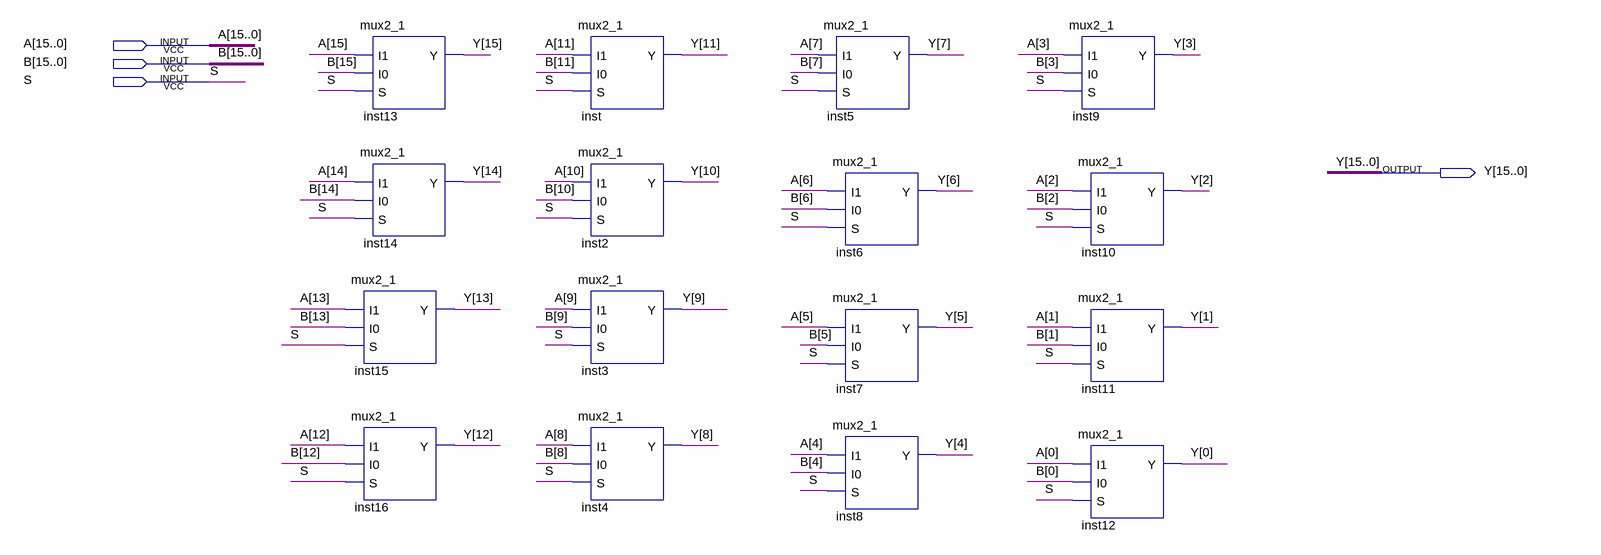
[diagram p0: schematic sheet]
// Quartus schematic mux2_1_16bit.bdf as structural Verilog: 16 symbols, 4 pins
module mux2_1_16bit (
  input  [15:0] A,
  input  [15:0] B,
  input  S,
  output [15:0] Y
);

  mux2_1 inst13 (.I1(A[15]), .I0(B[15]), .S(S), .Y(Y[15]));
  mux2_1 inst14 (.I1(A[14]), .I0(B[14]), .S(S), .Y(Y[14]));
  mux2_1 inst15 (.I1(A[13]), .I0(B[13]), .S(S), .Y(Y[13]));
  mux2_1 inst16 (.I1(A[12]), .I0(B[12]), .S(S), .Y(Y[12]));
  mux2_1 inst (.I1(A[11]), .I0(B[11]), .S(S), .Y(Y[11]));
  mux2_1 inst2 (.I1(A[10]), .I0(B[10]), .S(S), .Y(Y[10]));
  mux2_1 inst3 (.I1(A[9]), .I0(B[9]), .S(S), .Y(Y[9]));
  mux2_1 inst4 (.I1(A[8]), .I0(B[8]), .S(S), .Y(Y[8]));
  mux2_1 inst5 (.I1(A[7]), .I0(B[7]), .S(S), .Y(Y[7]));
  mux2_1 inst6 (.I1(A[6]), .I0(B[6]), .S(S), .Y(Y[6]));
  mux2_1 inst7 (.I1(A[5]), .I0(B[5]), .S(S), .Y(Y[5]));
  mux2_1 inst8 (.I1(A[4]), .I0(B[4]), .S(S), .Y(Y[4]));
  mux2_1 inst9 (.I1(A[3]), .I0(B[3]), .S(S), .Y(Y[3]));
  mux2_1 inst10 (.I1(A[2]), .I0(B[2]), .S(S), .Y(Y[2]));
  mux2_1 inst11 (.I1(A[1]), .I0(B[1]), .S(S), .Y(Y[1]));
  mux2_1 inst12 (.I1(A[0]), .I0(B[0]), .S(S), .Y(Y[0]));
endmodule
